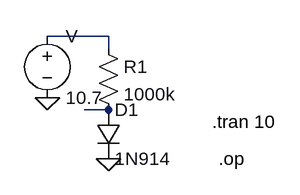
[diagram p0: schematic Draft9.asc]
Draft9.asc, the LTspice schematic file:
Version 4
SHEET 1 880 680
WIRE 400 144 320 144
WIRE 400 160 400 144
WIRE 400 240 368 240
FLAG 400 304 0
FLAG 320 224 0
DATAFLAG 368 240 "$"
SYMBOL diode 384 240 R0
SYMATTR InstName D1
SYMATTR Value 1N914
SYMBOL Res 384 144 R0
SYMATTR InstName R1
SYMATTR Value 1000k
SYMBOL Voltage 320 128 R0
SYMATTR InstName V
SYMATTR Value 10.7
TEXT 536 256 Left 2 !.tran 10
TEXT 544 304 Left 2 !.op

The netlist it stands for:
* Draft9.asc
D1 N002 0 1N914
R1 N001 N002 1000k
V N001 0 10.7
.model D D
.lib standard.dio
.tran 10
.op
.backanno
.end